# Altium schematic sheet Audio_Codec.SchDoc
size A4; SheetNumber: 4; SheetTotal: 13
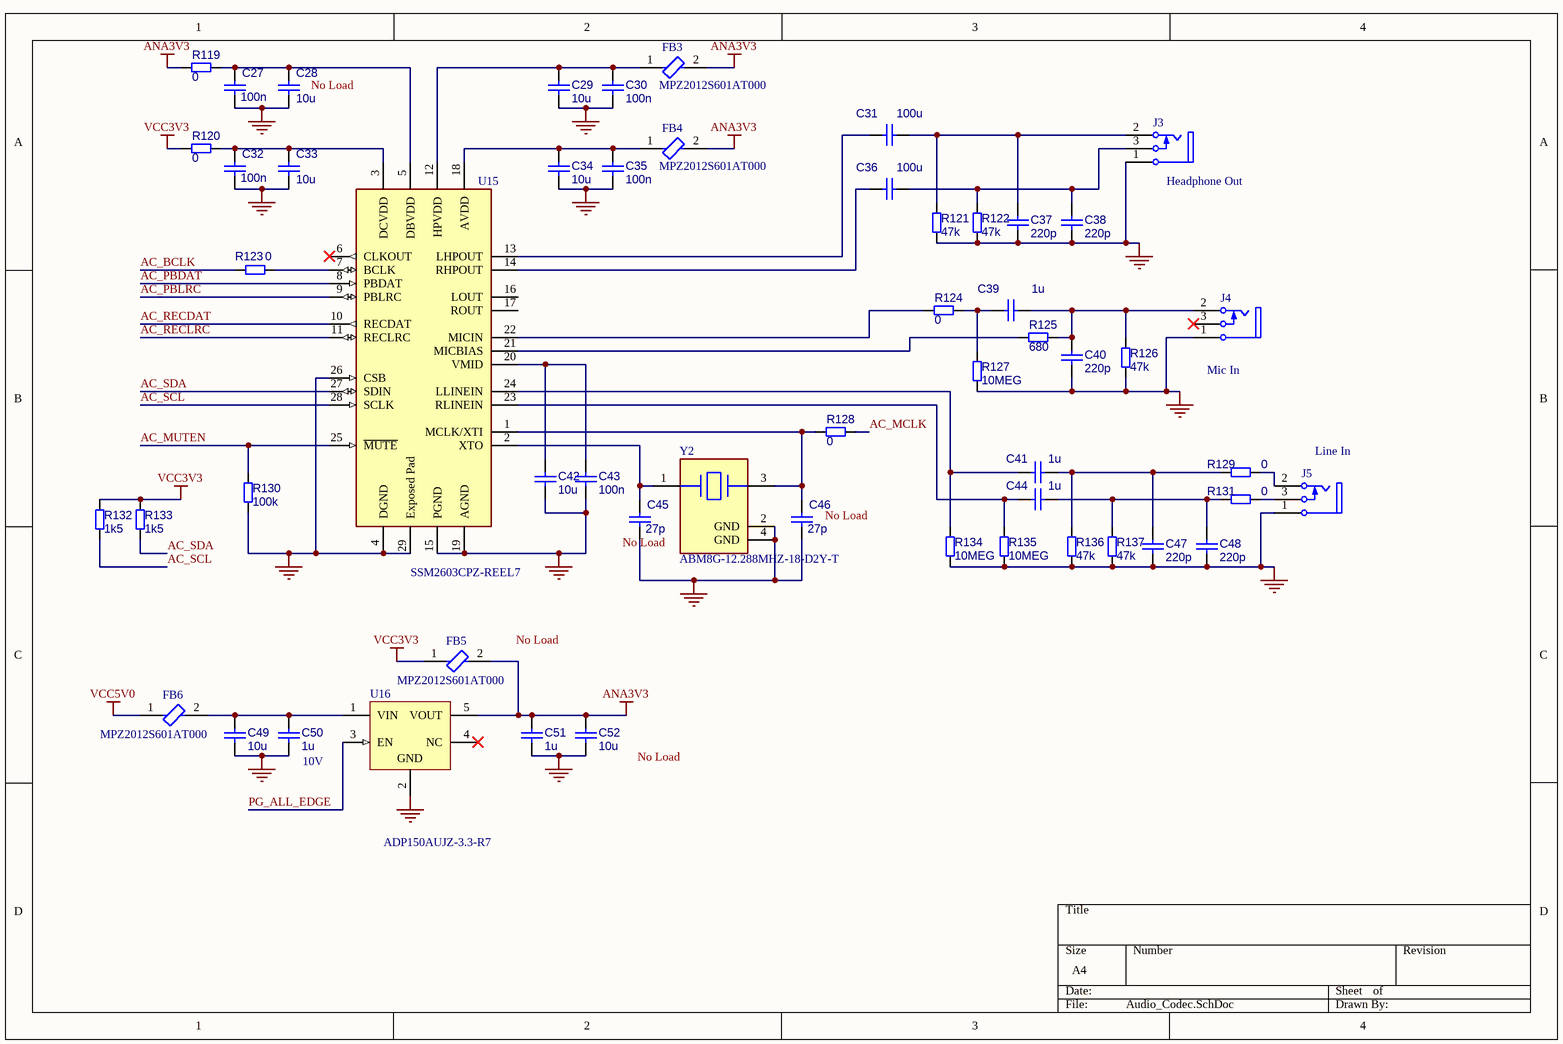
[diagram p0: Audio_Codec.SchDoc]

## Parts
C27  100n  [CAPC1005X50N_0402]
C28  10u  [C_0805]
C29  10u  [C_0805]
C30  100n  [CAPC1005X50N_0402]
C31  100u  [C_1210]
C32  100n  [CAPC1005X50N_0402]
C33  10u  [C_0805]
C34  10u  [C_0805]
C35  100n  [CAPC1005X50N_0402]
C36  100u  [C_1210]
C37  220p  [CAPC1005X50N_0402]
C38  220p  [CAPC1005X50N_0402]
C39  1u  [C_0402]
C40  220p  [CAPC1005X50N_0402]
C41  1u  [C_0402]
C42  10u  [C_0805]
C43  100n  [CAPC1005X50N_0402]
C44  1u  [C_0402]
C45  27p  [CAPC1005X50N_0402]
C46  27p  [CAPC1005X50N_0402]
C47  220p  [CAPC1005X50N_0402]
C48  220p  [CAPC1005X50N_0402]
C49  10u  [C_0805]
C50  1u  [CAPC1005X50N_0402]
C51  1u  [CAPC1005X50N_0402]
C52  10u  [C_0805]
FB3  MPZ2012S601AT000  [FP-MPZ2012-MFG]
FB4  MPZ2012S601AT000  [FP-MPZ2012-MFG]
FB5  MPZ2012S601AT000  [FP-MPZ2012-MFG]
FB6  MPZ2012S601AT000  [FP-MPZ2012-MFG]
J3  PJRAN1X1U01X  [SWIT-PJRAN1X1U01X_V]  (value not drawn)
J4  PJRAN1X1U01X  [SWIT-PJRAN1X1U01X_V]  (value not drawn)
J5  PJRAN1X1U01X  [SWIT-PJRAN1X1U01X_V]  (value not drawn)
R119  0  [R_0402]
R120  0  [R_0402]
R121  47k  [R_0402]
R122  47k  [R_0402]
R123  0  [R_0402]
R124  0  [R_0402]
R125  680  [R_0402]
R126  47k  [R_0402]
R127  10MEG  [R_0402]
R128  0  [R_0402]
R129  0  [R_0402]
R130  100k  [R_0402]
R131  0  [R_0402]
R132  1k5  [R_0402]
R133  1k5  [R_0402]
R134  10MEG  [R_0402]
R135  10MEG  [R_0402]
R136  47k  [R_0402]
R137  47k  [R_0402]
U15  SSM2603CPZ-REEL7  [FP-CP-28-10-IPC_C]
U16  ADP150AUJZ-3.3-R7  [ADI-UJ-5_M]
Y2  ABM8G-12.288MHZ-18-D2Y-T  [FP-ABM8G-MFG]

## Nets
ANA3V3: C51.2 C52.2 FB3.2 FB4.2 FB5.2 R119.2 U16.5(VOUT)
GND: C27.1 C28.1 C29.1 C30.1 C32.1 C33.1 C34.1 C35.1 C37.1 C38.1 C40.1 C42.1 C43.1 C45.1 C46.1 C47.1 C48.1 C49.1 C50.1 C51.1 C52.1 J3.1(SLEEVE) J4.1(SLEEVE) J5.1(SLEEVE) R121.2 R122.2 R126.2 R127.2 R130.2 R134.2 R135.2 R136.2 R137.2 U15.4(DGND) U15.15(PGND) U15.19(AGND) U15.26(CSB) U15.29(Exposed_Pad) U16.2(GND) Y2.2(GND) Y2.4(GND)
VCC3V3: FB5.1 R120.2 R132.1 R133.1
VCC5V0: FB6.1
AC_BCLK: R123.1
AC_MCLK: R128.1
AC_MUTEN: R130.1 U15.25(~{MUTE})
AC_PBDAT: U15.8(PBDAT)
AC_PBLRC: U15.9(PBLRC)
AC_RECDAT: U15.10(RECDAT)
AC_RECLRC: U15.11(RECLRC)
AC_SCL: R132.2 U15.28(SCLK)
AC_SDA: R133.2 U15.27(SDIN)
PG_ALL_EDGE: U16.3(EN)
NetC27_2: C27.2 C28.2 R119.1 U15.5(DBVDD)
NetC29_2: C29.2 C30.2 FB3.1 U15.12(HPVDD)
NetC31_1: C31.1 U15.13(LHPOUT)
NetC31_2: C31.2 C37.2 J3.2(TIP) R121.1
NetC32_2: C32.2 C33.2 R120.1 U15.3(DCVDD)
NetC34_2: C34.2 C35.2 FB4.1 U15.18(AVDD)
NetC36_1: C36.1 U15.14(RHPOUT)
NetC36_2: C36.2 C38.2 J3.3(SHUNT) R122.1
NetC39_1: C39.1 R124.1 R127.1
NetC39_2: C39.2 C40.2 J4.2(TIP) R125.1 R126.1
NetC41_1: C41.1 R134.1 U15.24(LLINEIN)
NetC41_2: C41.2 C47.2 R129.2 R136.1
NetC42_2: C42.2 C43.2 U15.20(VMID)
NetC44_1: C44.1 R135.1 U15.23(RLINEIN)
NetC44_2: C44.2 C48.2 R131.2 R137.1
NetC45_2: C45.2 U15.2(XTO) Y2.1
NetC46_2: C46.2 R128.2 U15.1(MCLK/XTI) Y2.3
NetC49_2: C49.2 C50.2 FB6.2 U16.1(VIN)
NetJ5_2: J5.2(TIP) R129.1
NetJ5_3: J5.3(SHUNT) R131.1
NetR123_2: R123.2 U15.7(BCLK)
NetR124_2: R124.2 U15.22(MICIN)
NetR125_2: R125.2 U15.21(MICBIAS)

Not connected (* = marked no-connect by the designer): J4 3(SHUNT)*; U15 6(CLKOUT)* 16(LOUT) 17(ROUT); U16 4(NC)*

## Notes on the sheet
- (near C28) No Load
- (near J3) Headphone Out
- (near J4) Mic In
- (near J5) Line In
- (near C46) No Load
- No Load
- (near FB5) No Load
- (near C50) 10V
- (near C52) No Load

## Library data of the parts
C27 C30 C32 C35 C37 C38 C40 C43 C45-C48 C50 C51 = CMP-001-00084-2: MLCC 0402
C28 C29 C33 C34 C42 C49 C52 = CMP-001-00086-2: MLCC 0805
C31 C36 = CMP-001-00088-1: 1210, X5R:EIA, 100uF, DC6.3V, GRM32ER60J107ME20
C39 C41 C44 = CMP-001-00085-2: MLCC 0603
FB3-FB6 = CMP-2000-05401-2: Manufacturer Lifecycle Status: PRODUCTION; NexarPartId: 12090955; RMS Current (Irms): 2A; Test Frequency: 100MHz; Tolerance: 25%; Core Material: Ferrite; Series Resistance: 100mΩ; Impedance: 600Ω; Packaging: Digi-Reel®; Length: 2mm; Min Operating Temperature: -55°C; Width: 1.25mm; Max Width: 1.45mm; Lead Free: Lead Free; Current Rating: 2A; Case Code (Imperial): 0805; Min Length: 1.8mm; Schedule B: 8504500000, 8504500000; REACH SVHC: No SVHC; Case Code (Metric): 2012; Max DC Current: 2A; Case/Package: 0805; Lifecycle Status: Production; Min Width: 1.05mm; Mount: Surface Mount; Height: 1.0414mm; Resistance: 100mΩ; DC Resistance (DCR): 100mΩ; Max Operating Temperature: 125°C; Max Length: 2.2mm; RoHS: Compliant
J3-J5 = CMP-1772-00003-1: Female Phono Jack, 3 Position, Height 13 mm, Tail Length 4 mm, RoHS, Bulk; Case\Package: Radial; Type (Capacitors): X7R; Tolerance: 10%; Voltage Rating (DC): 50 V; Capacitance: 100 nF; Package Quantity: 500; Mount: Through Hole; Packaging: Bulk; Height: 3.18 mm; Min Operating Temperature: -55 degC; Radiation Hardening: No; PackageDescription: Female Phono Jack, 3 Position, Height 13 mm, Tail Length 4 mm; Length: 6.6 mm; Lead Pitch: 2.54 mm; Width: 5.08 mm; REACH SVHC: No SVHC; ComponentLink1Description: Manufacturer URL; Max Operating Temperature: 125 degC; ComponentLink2Description: Datasheet; DatasheetVersion: Rev. A, 01/2006; Voltage Rating: 50 V; ComponentLink2URL: http://www.conxall.com/Drawings/pjran1x1u__x_series_cd.pdf; ComponentLink1URL: http://www.switchcraft.com/; RoHSCompliant: true; Pins: 2; PackageReference: PJRAN1X1U01X
R119-R137 = CMP-009-00178-3: Chip 0402 resistor
U15 = CMP-020-00026-1: Tape & Reel (TR) EAR99 Active Matte Tin (Sn) codec 90dB 1.5V 5mm 96ksps; Max Supply Voltage: 3.6V; Interface: SPI; Case/Package: LFCSP EP; Max Operating Temperature: 85°C; Min Operating Temperature: -40°C; Min Supply Voltage: 1.5V; Pins: 28; Mounting Technology: Surface Mount
U16 = CMP-0786-00394-1: Ultralow Noise, 150 mA CMOS Linear Regulator, 2.2 to 5.5 V Vin, 3.3 V Vout, Industrial, 5-pin SOT23 (UJ-5), Reel; Manufacturer: Analog Devices; Supply Current IGND @ Small Load: 10uA; Vin (min) (V): 2.2; Iout max: 150mA; Preset Vout Values (V): 3.3; Vin (max) (V): 5.5; ComponentLink2Description: Datasheet; PackageReference: UJ-5; DatasheetVersion: Rev. A; PackageDescription: 5-Pin Thin Small Outline Transistor Package, Body 2.9 x 1.6 mm, Pitch 0.95 mm; ComponentLink4URL: Product URL:http://www.analog.com/en/ADP150/productSearch.html; Packing: Reel; ComponentLink1URL: http://www.analog.com/en/index.html; PartNumber: ADP150AUJZ-3.3-R7; PackageVersion: 100708-A, 10/2008; ComponentLink3Description: Package Specification; ComponentLink3URL: http:/www.analog.com/static/imported-files/packages/PKG_PDF/TSOT(UJ)/UJ_5.pdf; ComponentLink4Description: URL Link1; ComponentLink2URL: http://www.analog.com/static/imported-files/data_sheets/ADP150.pdf; Code_JEDEC: MO-193-AB; Mounting Technology: Surface Mount; ComponentLink1Description: Manufacturer URL
Y2 = CMP-27762-015475-1: Crystal 12.288MHz ±20ppm (Tol) ±30ppm (Stability) 18pF FUND 80Ω 4-Pin SMD T/R; Series Resistance: 80R; Packaging: Tape and Reel; Operating Frequency: 12.288 MHz; Load Capacitance: 18pF; Frequency Stability: 30ppm; Package Quantity: 1000; Length: 3.2mm; Lead Free: Lead Free; Termination: SMD/SMT; REACH SVHC: Yes; Number of Pins: 4; Tolerance: 20ppm; Width: 0.098inch; Mount: Surface Mount; Depth: 2.5mm; Series: ABM8G; Height: 0.039inch; ESR (Equivalent Series Resistance): 80R; Min Operating Temperature: -40°C; Frequency: 12.288MHz; Max Operating Temperature: 85°C; Frequency Tolerance: 20ppm; Case/Package: SMD/SMT